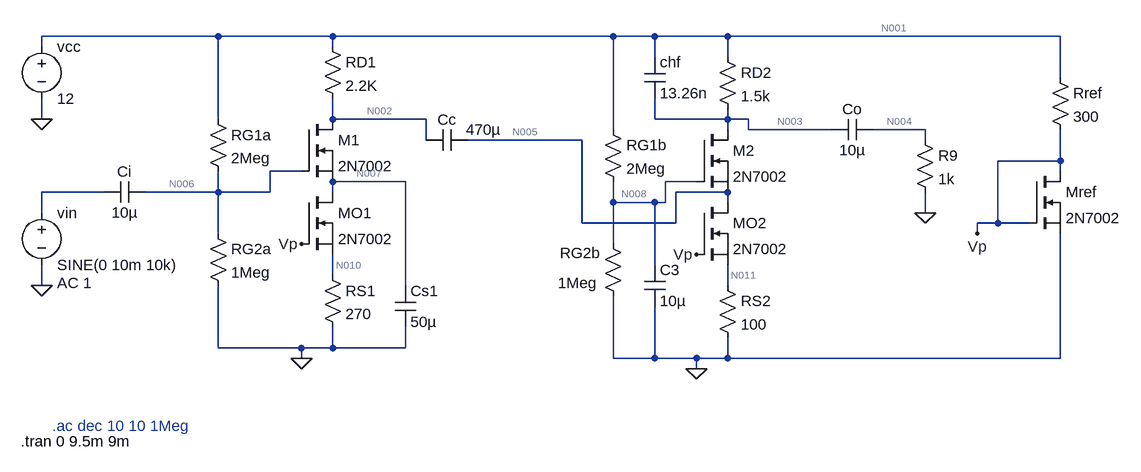
[diagram p0: schematic TP3_6-8n.asc]
TP3_6-8n.asc, the LTspice schematic file:
Version 4.1
SHEET 1 1840 696
WIRE 304 48 32 48
WIRE 480 48 304 48
WIRE 912 48 480 48
WIRE 976 48 912 48
WIRE 1088 48 976 48
WIRE 1600 48 1088 48
WIRE 32 64 32 48
WIRE 480 64 480 48
WIRE 976 80 976 48
WIRE 1088 80 1088 48
WIRE 1600 112 1600 48
WIRE 32 176 32 144
WIRE 304 176 304 48
WIRE 480 176 480 144
WIRE 624 176 480 176
WIRE 976 176 976 144
WIRE 1088 176 1088 160
WIRE 1088 176 976 176
WIRE 1120 176 1088 176
WIRE 912 192 912 48
WIRE 1088 192 1088 176
WIRE 1120 192 1120 176
WIRE 1248 192 1120 192
WIRE 1392 192 1312 192
WIRE 624 208 624 176
WIRE 864 208 688 208
WIRE 1392 208 1392 192
WIRE 1600 240 1600 192
WIRE 1600 240 1504 240
WIRE 432 256 384 256
WIRE 1600 256 1600 240
WIRE 592 272 480 272
WIRE 1040 272 992 272
WIRE 128 288 32 288
WIRE 304 288 304 256
WIRE 304 288 192 288
WIRE 384 288 384 256
WIRE 384 288 304 288
WIRE 480 288 480 272
WIRE 1088 288 1008 288
WIRE 912 304 912 272
WIRE 976 304 912 304
WIRE 992 304 992 272
WIRE 992 304 976 304
WIRE 1088 304 1088 288
WIRE 32 320 32 288
WIRE 1392 320 1392 288
WIRE 864 336 864 208
WIRE 1008 336 1008 288
WIRE 1008 336 864 336
WIRE 1504 336 1504 240
WIRE 1504 336 1472 336
WIRE 1552 336 1504 336
WIRE 304 352 304 288
WIRE 1472 352 1472 336
WIRE 912 368 912 304
WIRE 976 400 976 304
WIRE 480 416 480 384
WIRE 32 432 32 400
WIRE 592 432 592 272
WIRE 1088 432 1088 400
WIRE 304 528 304 432
WIRE 432 528 304 528
WIRE 480 528 480 496
WIRE 480 528 432 528
WIRE 592 528 592 496
WIRE 592 528 480 528
WIRE 432 544 432 528
WIRE 912 544 912 448
WIRE 976 544 976 464
WIRE 976 544 912 544
WIRE 1040 544 976 544
WIRE 1088 544 1088 512
WIRE 1088 544 1040 544
WIRE 1600 544 1600 352
WIRE 1600 544 1088 544
WIRE 1040 560 1040 544
FLAG 32 176 0
FLAG 32 432 0
FLAG 432 544 0
FLAG 432 368 Vp
FLAG 1040 560 0
FLAG 1040 384 Vp
FLAG 1392 320 0
FLAG 1472 352 Vp
SYMBOL voltage 32 48 R0
WINDOW 123 0 0 Left 0
WINDOW 39 0 0 Left 0
SYMATTR InstName vcc
SYMATTR Value 12
SYMBOL voltage 32 304 R0
WINDOW 123 24 124 Left 2
WINDOW 39 0 0 Left 0
SYMATTR Value2 AC 1
SYMATTR InstName vin
SYMATTR Value SINE(0 10m 10k)
SYMBOL cap 192 272 R90
WINDOW 0 0 32 VBottom 2
WINDOW 3 32 32 VTop 2
SYMATTR InstName Ci
SYMATTR Value 10µ
SYMBOL res 288 160 R0
SYMATTR InstName RG1a
SYMATTR Value 2Meg
SYMBOL res 288 336 R0
SYMATTR InstName RG2a
SYMATTR Value 1Meg
SYMBOL res 464 48 R0
SYMATTR InstName RD1
SYMATTR Value 2.2K
SYMBOL res 464 400 R0
SYMATTR InstName RS1
SYMATTR Value 270
SYMBOL res 896 176 R0
SYMATTR InstName RG1b
SYMATTR Value 2Meg
SYMBOL res 896 352 R0
WINDOW 3 -69 76 Left 2
WINDOW 0 -66 30 Left 2
SYMATTR Value 1Meg
SYMATTR InstName RG2b
SYMBOL res 1072 64 R0
SYMATTR InstName RD2
SYMATTR Value 1.5k
SYMBOL res 1072 416 R0
SYMATTR InstName RS2
SYMATTR Value 100
SYMBOL cap 688 192 R90
WINDOW 0 0 32 VBottom 2
WINDOW 3 -16 -24 VTop 2
SYMATTR InstName Cc
SYMATTR Value 470µ
SYMBOL cap 960 400 R0
SYMATTR InstName C3
SYMATTR Value 10µ
SYMBOL cap 960 80 R0
SYMATTR InstName chf
SYMATTR Value 13.26n
SYMBOL cap 1312 176 R90
WINDOW 0 0 32 VBottom 2
WINDOW 3 32 32 VTop 2
SYMATTR InstName Co
SYMATTR Value 10µ
SYMBOL res 1376 192 R0
SYMATTR InstName R9
SYMATTR Value 1k
SYMBOL res 1584 96 R0
SYMATTR InstName Rref
SYMATTR Value 300
SYMBOL cap 576 432 R0
SYMATTR InstName Cs1
SYMATTR Value 50µ
SYMBOL nmos 432 176 R0
SYMATTR InstName M1
SYMATTR Value 2N7002
SYMBOL nmos 432 288 R0
SYMATTR InstName MO1
SYMATTR Value 2N7002
SYMBOL nmos 1040 304 R0
SYMATTR InstName MO2
SYMATTR Value 2N7002
SYMBOL nmos 1040 192 R0
SYMATTR InstName M2
SYMATTR Value 2N7002
SYMBOL nmos 1552 256 R0
SYMATTR InstName Mref
SYMATTR Value 2N7002
TEXT 48 648 Left 2 ;.ac dec 10 10 1Meg
TEXT 0 672 Left 2 !.tran 0 9.5m 9m

The netlist it stands for:
* TP3_6-8n.asc
vcc N001 0 12
vin N009 0 SINE(0 10m 10k) AC 1
Ci N006 N009 10µ
RG1a N001 N006 2Meg
RG2a N006 0 1Meg
RD1 N001 N002 2.2K
RS1 N010 0 270
RG1b N001 N008 2Meg
RG2b N008 0 1Meg
RD2 N001 N003 1.5k
RS2 N011 0 100
Cc N005 N002 470µ
C3 N008 0 10µ
chf N001 N003 13.26n
Co N004 N003 10µ
R9 N004 0 1k
Rref N001 Vp 300
Cs1 N007 0 50µ
M1 N002 N006 N007 N007 2N7002
MO1 N007 Vp N010 N010 2N7002
MO2 N005 Vp N011 N011 2N7002
M2 N003 N008 N005 N005 2N7002
Mref Vp Vp 0 0 2N7002
.model NMOS NMOS
.model PMOS PMOS
.lib standard.mos
* .ac dec 10 10 1Meg
.tran 0 9.5m 9m
.backanno
.end

* Results of the author's LTspice run, read from the files saved beside the schematic
* Operating Point, zero values left out:
*   V(n001) = 12 V
*   V(n002) = 7.791 V
*   V(n003) = 5.599 V
*   V(n005) = 2.184 V
*   V(n006) = 4 V
*   V(n007) = 2.274 V
*   V(n008) = 4 V
*   V(n010) = 516.5 mV
*   V(n011) = 426.7 mV
*   V(vp) = 2.243 V
*   I(RD1) = 1.913 mA
*   I(RD2) = 4.267 mA
*   I(RG1a) = 4 µA
*   I(RG1b) = 4 µA
*   I(RG2a) = 4 µA
*   I(RG2b) = 4 µA
*   I(RS1) = 1.913 mA
*   I(RS2) = 4.267 mA
*   I(Rref) = 32.52 mA
*   I(vcc) = -38.71 mA
*   Id(M1) = 1.913 mA
*   Id(M2) = 4.267 mA
*   Id(MO1) = 1.913 mA
*   Id(MO2) = 4.267 mA
*   Id(Mref) = 32.52 mA
*   Is(M1) = -1.913 mA
*   Is(M2) = -4.267 mA
*   Is(MO1) = -1.913 mA
*   Is(MO2) = -4.267 mA
*   Is(Mref) = -32.52 mA
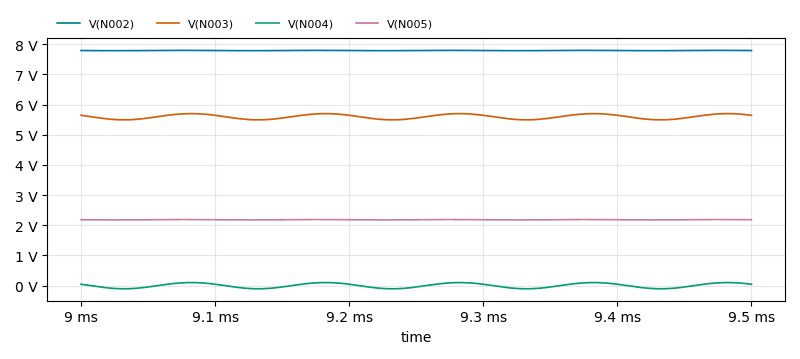
[diagram p1: Transient Analysis of TP3_6-8n.asc, plotted from the saved traces]
* Transient Analysis, 1 run:
*   V(N002): min 7.785 V, max 7.797 V, average 7.791 V, rms 7.791 V, last 7.791 V
*   V(N003): min 5.494 V, max 5.7 V, average 5.599 V, rms 5.599 V, last 5.645 V
*   V(N004): min -104.5 mV, max 101.8 mV, average 126.4 µV, rms 72.95 mV, last 46.8 mV
*   V(N005): min 2.178 V, max 2.19 V, average 2.184 V, rms 2.184 V, last 2.184 V